# Altium schematic sheet POWER.SchDoc
size A; SheetNumber: 4; SheetTotal: 4
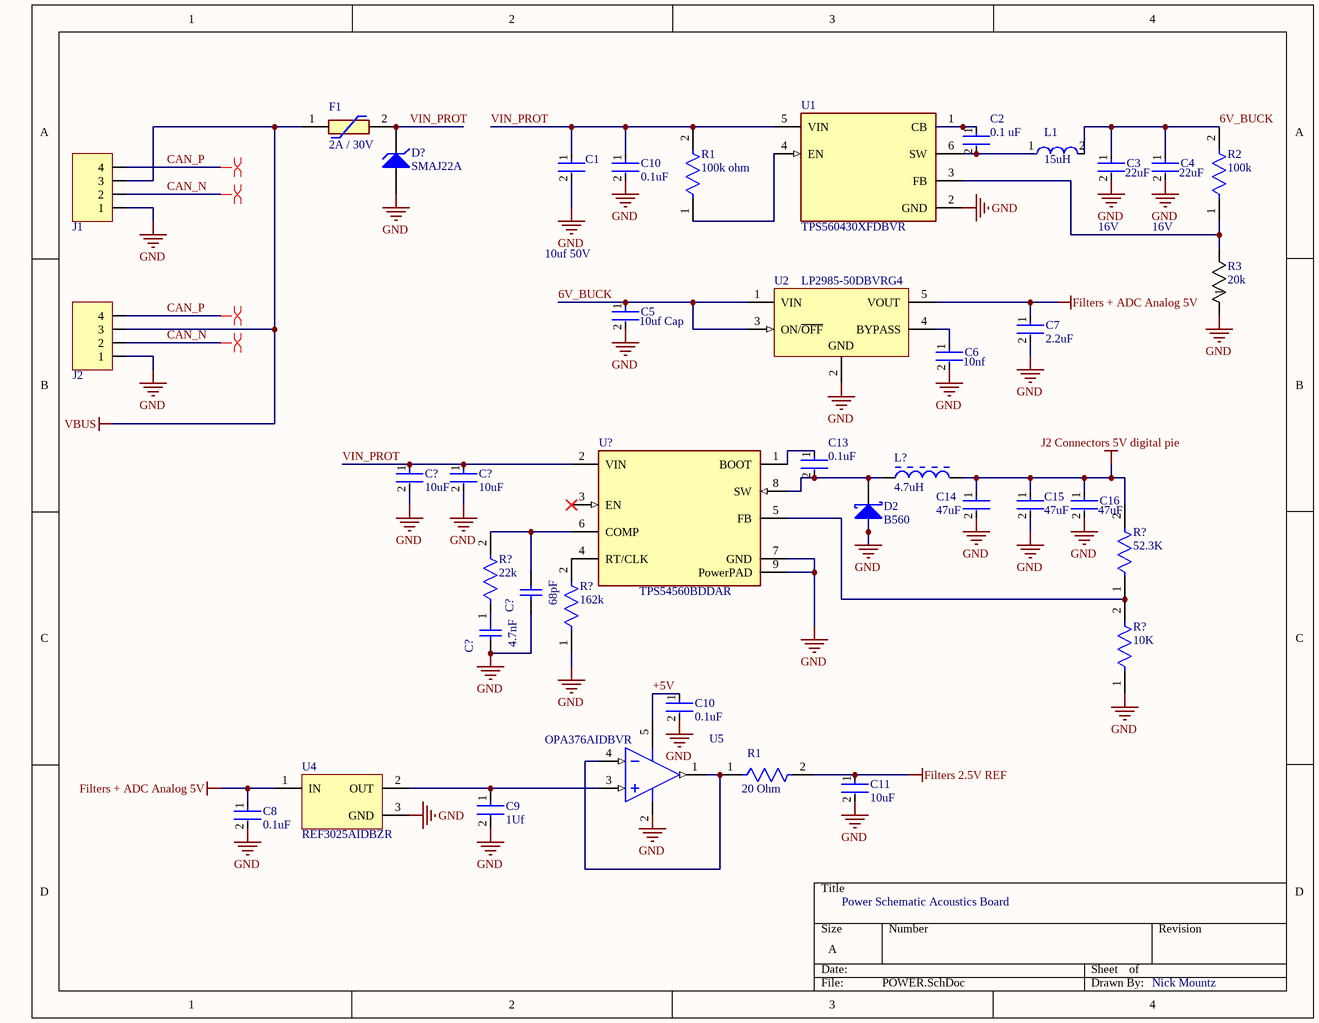
[diagram p0: POWER.SchDoc]

## Parts
(Parts that share a designator on the sheet are numbered #1, #2 ... from top to bottom, then left to right.)
?  47uF  [FP-ZRB18A-0_2-MFG]
C1  10uf 50V  [FP-ZRB15X-0_22-MFG]
C2  0.1 uF  [FP-GRMJN6-0_1-MFG]
C3  22uF  [FP-GCJ31C-0_3-MFG]
C4  22uF  [FP-GCJ31C-0_3-MFG]
C5  10uf Cap  [FP-ZRB15X-0_22-MFG]
C6  10nf  [FP-C0805C103K8RACAUTO-MFG]
C7  2.2uF  [FP-ZRB155-0_2-MFG]
C8  0.1uF  [FP-GRM022-0_02-IPC_C]
C9  1Uf  [FP-RCE1K1-MFG]
C10#1  0.1uF  [FP-GRM022-0_02-IPC_C]
C10#2  0.1uF  [FP-GRM022-0_02-IPC_C]
C11  10uF  [FP-ZRB15X-0_22-MFG]
C13  0.1uF  [FP-ZRB15X-0_22-MFG]
C15  47uF  [FP-ZRB18A-0_2-MFG]
C16  47uF  [FP-ZRB18A-0_2-MFG]
C?#1  10uF  [FP-ZRB15X-0_22-MFG]
C?#2  10uF  [FP-ZRB15X-0_22-MFG]
C?#3  68pF  [WCAP-CSMH_1808_H1.25]
C?#4  4.7nF  [WCAP-CSGP_0402_L1W0.5H0.5]
D2  B560  [DIOD-B5X0C-2_M]
D?  SMAJ22A  [LFUS-DO-214AC-2_L]
F1  2A / 30V  [MFLSMF20033X2]
J1  Microfit+ R/A  [CONN_MOLEX_MICROFIT+_4_POS_R/A - duplicate]  (value not drawn)
J2  Microfit+ R/A  [CONN_MOLEX_MICROFIT+_4_POS_R/A - duplicate]  (value not drawn)
L1  15uH  [FP-IHLP-6767GZ-FP_3_825x1-MFG]
L?  4.7uH  [BOUR-SRN3015-2_V]
R1#1  100k ohm  [FP-RQ73C2A-IPC_B]
R1#2  20 Ohm  [FP-AF0201-IPC_A]
R2  100k  [FP-RQ73C2A-IPC_B]
R3  20k  [MCA 1206_VIS]
R?#1  52.3K  [FP-MCR03-IPC_C]
R?#2  22k  [FP-CRGP0603-IPC_C]
R?#3  162k  [FP-RP73P-1E-MFG]
R?#4  10K  [FP-AC0603-IPC_A]
U1  TPS560430XFDBVR  [FP-DBV0006A-IPC_C]
U2  LP2985-50DBVRG4  [DBV0005A_L]
U4  REF3025AIDBZR  [DBZ0003A_L]
U5  OPA376AIDBVR  [DBV0005A_L]
U?  TPS54560BDDAR  [FP-DDA0008E-MFG]

## Nets
Filters 2.5V REF: C11.1 R1#2.2
Filters + ADC Analog 5V: C7.1 C8.1 U2.5(VOUT) U4.1(IN)
GND: ?.2 C1.2 C3.2 C4.2 C5.2 C6.2 C7.2 C8.2 C9.2 C10#1.2 C10#2.2 C11.2 C15.2 C16.2 C?#1.2 C?#2.2 C?#3.1 C?#4.1 D2.2(A) D?.1(A) J1.1 J2.1 R3.1 R?#3.1 R?#4.1 U1.2(GND) U2.2(GND) U4.3(GND) U?.7(GND) U?.9(PowerPAD)
J2 Connectors 5V digital pie: ?.1 C15.1 C16.1 L?.2 R?#1.2
VBUS: F1.1 J1.3 J2.3
6V_BUCK: C3.1 C4.1 C5.1 L1.2 R2.2 U2.1(VIN) U2.3(ON/~{OFF})
+5V: C10#2.1 U5.5(V+)
CAN_N: J1.2 J2.2
CAN_P: J1.4 J2.4
VIN_PROT: C1.1 C10#1.1 C?#1.1 C?#2.1 D?.2(K) F1.2 R1#1.2 U1.5(VIN) U?.2(VIN)
NetC2_1: C2.1 U1.1(CB)
NetC2_2: C2.2 L1.1 U1.6(SW)
NetC6_1: C6.1 U2.4(BYPASS)
NetC9_1: C9.1 U4.2(OUT) U5.3(IN+)
NetC13_1: C13.1 U?.1(BOOT)
NetC13_2: C13.2 D2.1(K) L?.1 U?.8(SW)
NetC?#3_2: C?#3.2 R?#2.2 U?.6(COMP)
NetC?#4_2: C?#4.2 R?#2.1
NetR1#1_1: R1#1.1 U1.4(EN)
NetR1#2_1: R1#2.1 U5.1(OUT) U5.4(IN-)
NetR2_1: R2.1 R3.2 U1.3(FB)
NetR?#1_1: R?#1.1 R?#4.2 U?.5(FB)
NetR?#3_2: R?#3.2 U?.4(RT/CLK)

Not connected (* = marked no-connect by the designer): U5 2(V-); U? 3(EN)*

## Layout directives
differential pair: CAN_N, CAN_P

## Notes on the sheet
- 16V
- (near L?) C14
- Power Schematic Acoustics Board
- Nick Mountz
- Labels drawn without touching a wire or pin: GND

## Library data of the parts
? C15 C16 = CMP-06035-063273-1: Low Acoustic Noise Chip Multilayer Ceramic Capacitors on Interposer Board for General Purpose 	47μF ±20% 2.5VDC SMD 0603
C1 C5 C11 C13 C?#1 C?#2 = CMP-06035-063245-1: Multilayer Ceramic Capacitors on Interposer Board for General Purpose 10μF ±20% 4VDC X6S  SMD  0402
C2 = CMP-00260-135708739-1: GRMJN65C1H104JE01D Multilayer Ceramic Capacitor, 0.1 uF, 50 V, ± 5%, C0G (NP0), 0704 [1810 Metric]; Temperature Coefficient: 30ppm/°C; Capacitance: 100nF; Voltage Rating: 50V; Tolerance: 5%; Min Operating Temperature: -55°C; Case/Package: 0704; Material: Ceramic; NexarPartId: 135708739; Height: 650µm; Lifecycle Status: Production; Max Operating Temperature: 125°C
C3 C4 = CMP-06035-003359-1: Cap Ceramic 22uF 10V X7R 20% Pad SMD 1206 Soft Termination  +125°C Automotive T/R
C6 = CMP-00212-126448506-1: C0805C103K8RACAUTO Cap, 0.01UF, 10V, Mlcc, 0805 Rohs Compliant: Yes; Material: Ceramic; Dielectric: X7R; Tolerance: 10%; Height: 880µm; NexarPartId: 126448506; Voltage Rating: 10V; Voltage Rating (DC): 10V; Min Operating Temperature: -55°C; Capacitance: 10nF; Max Operating Temperature: 125°C; Case/Package: 0805; RoHS: Compliant
C7 = CMP-06035-063357-1: Low Acoustic Noise Chip Multilayer Ceramic Capacitors on Interposer Board for General Purpose ZRB Series 0402 Package X5R @ 15% 25Vdc 2.2uF @ 20%
C8 C10#1 C10#2 = CMP-06035-051810-1: Chip Multilayer Ceramic Capacitors for General Purpose, 01005, 0.10uF, X5R, 15%, 20%, 10V
C9 = CMP-00260-148573931-1: RCEC72A105K1K1H03B; Capacitance: 1µF; Tolerance: 10%; Material: Ceramic; Voltage Rating: 100V; Min Operating Temperature: -55°C; Case/Package: Radial; Max Operating Temperature: 125°C; Lifecycle Status: Production; Height: 5mm
C?#3 = CMP-03913-89205720-2: Cap Ceramic 68pF 3000V C0G 5% Pad SMD 1808 125C T/R; Insulation Resistance: 10GΩ; Voltage Rating (DC): 3kV; Voltage Rating: 3kV; Min Operating Temperature: -55°C; Length: 4.5mm; Max Operating Temperature: 125°C; RoHS: Compliant; Width: 2.03mm; Capacitance: 68pF; Height: 1.25mm
C?#4 = CMP-03913-53703202-2: Cap Ceramic 0.0047uF 50V X7R 10% Pad SMD 0402 125C T/R; Insulation Resistance: 10GΩ; Material: Ceramic; Tolerance: 10%; Length: 1mm; RoHS: Compliant; Max Operating Temperature: 125°C; Capacitance: 4.7nF; Voltage Rating: 50V; Case/Package: 0402; Width: 500µm; Mount: Surface Mount; Min Operating Temperature: -55°C; Case Code (Imperial): 0402; Height: 500µm; Packaging: Tape & Reel (TR); Thickness: 558.8µm; Case Code (Metric): 1005
D2 = CMP-2000-05098-2: Schottky Barrier Rectifier, 5 A, 60 V, -55 to 125 degC, 2-Pin SMD, RoHS, Tape and Reel; Ir - Reverse Current: 500uA; Configuration: Single; Ifsm - Forward Surge Current: 100A; Vrrm - Repetitive Reverse Voltage: 60V; Brand: DiodesIncorporated; Vf - Forward Voltage: 0.7V; If - Forward Current: 5A; Unit Weight: 0.007408oz; Type: SchottkyBarrierRectifier; Package / Case: SMC; Manufacturer URL: http://www.diodes.com/; Datasheet URL: https://datasheet.ciiva.com/27052/1538961-27052355.pdf; Factory Pack Quantity: 3000; Height: 2.5mm; Width: 6.22mm; Product Category: SchottkyDiodes&Rectifiers; Minimum Operating Temperature: -55C; Manufacturer: DiodesIncorporated; Datasheet Version: Rev. 7-2, 06/2007; Product: SchottkyDiodes; Maximum Operating Temperature: +125C; Operating Temperature Range: -55Cto+125C; Technology: Si; Length: 7.11mm; RoHS: True; Packaging: Reel; Termination Style: SMD/SMT; Series: B560; Mounting Style: SMD/SMT
D? = CMP-2000-07086-1: Transient Voltage Suppression Diode, 400 W, 22 V, -65 to 150 degC, 2-Pin SMD, RoHS, Tape and Reel; Manufacturer: Littelfuse; Power Dissipation: 400W; Directional: Uni-Directional; Breakdown Voltage-Min: 24.4V; Clamping Voltage-Max: 35.5V; Breakdown Voltage-Max: 26.9V; Manufacturer URL: http://www.littelfuse.com/; Datasheet Version: 11/2015; Package Reference: DO-214AC; Package Description: 2-Pin Surface Mount Device, Body 4.295 x 2.595 mm; Datasheet URL: http://www.littelfuse.com/~/media/electronics/datasheets/tvs_diodes/littelfuse_tvs_diode_smaj_datasheet.pdf.pdf; Mounting Technology: SurfaceMount
F1 = MF-LSMF200_33X-2: Resettable Fuse; Manufacturer_Name: Bourns; Manufacturer_Part_Number: MF-LSMF200/33X-2; Datasheet Link: https://www.bourns.com/docs/product-datasheets/mf-lsmf.pdf; Height: 1.6mm
J1 J2 = CONN_MOLEX_MICROFIT+_4POS_R/A: Molex Microfit+ / 212528 4 POS R/A Black; Pitch: 3.0mm; Current Per Pin: 12.5A; Manufacturer: Molex; Supplier 1: Digikey; Supplier Part Number 1: 900-2125280400-ND; Configuration: R/A; Color: Black
L1 = CMP-02424-000082-1: Commercial Inductors, High Saturation Series 15uH 12.5A 19.9mΩ 20%; DC Resistance (DCR): 19.9mR; Self Resonant Frequency: 2MHz; Saturation Current: 25A; Core Material: Metal; Shielding: Shielded; Test Frequency: 100kHz; Inductance: 15uH; Depth: 17.15mm; Case/Package: 6767; Height - Seated (Max): 0.157inch; Mount: Surface Mount; Contact Plating: Tin; Radiation Hardening: No; Tolerance: 20%; Lead Free: Lead Free; Military Standard: Not; Height: 7mm; Width: 0.675inch; Max Operating Temperature: 125°C; Packaging: Tape and Reel; Min Operating Temperature: -55°C; Package Quantity: 200; Length: 17.28mm; Termination: SMD/SMT; Current Rating: 12.5A; Max DC Current: 25A
L? = CMP-0007-00005-1: Semi-shielded Power Inductor, 4.7 uH, +/- 20%, 1.4 A, -40 to 125 degC, 3 x 3 x 1.5 mm SMD, RoHS and Halogen Free, Tape and Reel; Manufacturer: Bourns; PartNumber: SRN3015-4R7M; SRF Min: 65 MHz; Isat: 1.2 A; Resistance to Solder Heat: +260 degC for 10 sec.; Rated current: 1.4 A; Inductance tolerance: +/- 20%; DCR Max: 0.136 Ohm; RoHS: TRUE; Inductance: 4.7 uH; ComponentLink2Description: Datasheet; PackageDescription: 2-Pin SMD, Body 3 x 3 mm, Height 1.5 mm; ComponentLink2URL: http://www.bourns.com/data/global/pdfs/SRN3015.pdf; ComponentLink1URL: http://www.bourns.com/; Packing: Tape and Reel; Mounting Technology: Surface Mount; ComponentLink3URL: http://www.bourns.com/data/global/pdfs/SRN3015.pdf; PackageReference: SRN3015; Operating Temperature: -40 to 125 degC; DatasheetVersion: Aug-11; ComponentLink1Description: Manufacturer URL; ComponentLink3Description: Package Specification
R1#1 R2 = CMP-03211-011351-1: RQ73 0805 100KΩ 0.2W 10ppm/°C 0.1% 100V
R1#2 = CMP-03412-047168-1: Anti-Sulfurated Chip Resistors Automotive Grade 20Ω 5% 200ppm/°C 0201; Max Power Dissipation: 50mW; Resistance: 20R; Temperature Coefficient: 200ppm/°C; Height: 0.01inch; Packaging: Tape and Reel; Case/Package: 0201; Number of Terminations: 2; Length: 0.024inch; Series: AF; Max Operating Temperature: 125°C; Resistor Type: Thick Film; Min Operating Temperature: -55°C; Features: Moisture Resistant; Width: 0.012inch; Tolerance: 5%; RoHS Compliant: Yes
R3 = CMP-00030-44469054-1: MCA12060D2002BP500 SMD Chip Resistor, 20 kOhm, ± 0.1%, 250 mW, 1206 [3216 Metric], Thin Film, Precision; Resistance: 20kΩ; Temperature Coefficient: 25ppm/°C; Power Rating: 250mW; Voltage Rating: 200V; RoHS: Compliant; NexarPartId: 44469054; Lead Free: Lead Free; Composition: Thin Film; Tolerance: 0.1%; Min Operating Temperature: -55°C; Max Operating Temperature: 125°C; Depth: 1.6mm; Packaging: Tape and Reel; Military Standard: Not; Height: 650µm; Width: 1.6mm; Case/Package: 1206; Length: 3.2mm
R?#1 = CMP-08839-006883-1: Thick Film Chip Resistor, 0603, 52.3kΩ, 1%, 100ppm/°C, 0.1W, 50V
R?#2 = CMP-03211-006681-1: CRGP 0603 22K 1%; Manufacturer Part Number: CRGP0603F22K; Manufacturer: TE; Resistance: 22KΩ; Power Rating: 0.25W; Temperature Coefficient: ±100ppm/°C; Tolerance: 0.01; Voltage Rating: 50V; Value: 22KΩ; Lead Free: Yes; Device Class L3: Chip SMD Resistors; Ipc Land Pattern Name: RESC16080X45; Composition: Thick Film; Octopart: https://octopart.com/crgp0603f22k-te+connectivity-91018742; RoHS: TRUE; ComponentLink2Description: Datasheet; Digikey Description: CRGP 0603 22K 1%; Category: Res; Temperature: -55°C to +155°C; Temperature Range High: +155°C; Series: CRGP; ComponentLink2URL: https://www.te.com/commerce/DocumentDelivery/DDEController?Action=srchrtrv&DocNm=9-1773463-9&DocType=DS&DocLang=English; Device Class L2: Resistors; Height: 0.55mm; Ambient Temperature Range High: +70°C; Device Class L1: Passive Components; Automotive: No; Temperature Range Low: -55°C; Package: CRGP0603
R?#3 = CMP-03211-007818-1: RP73P 0402 162KΩ 0.1W 25ppm/°C 0.10% 50V; Manufacturer Part Number: RP73PF1E162KBTD; Manufacturer: TE Connectivity; Temperature Range High: +155°C; Device Class L1: Passive Components; Voltage Rating: 50V; Category: Res; Ipc Land Pattern Name: RESC10050X30; RoHS: TRUE; Resistance: 162KΩ; Device Class L3: Chip SMD Resistors; Octopart: https://octopart.com/rp73pf1e162kbtd-te+connectivity-89229970; Value: 162KΩ; Lead Free: Yes; Device Class L2: Resistors; ComponentLink2URL: https://www.te.com/commerce/DocumentDelivery/DDEController?Action=srchrtrv&DocNm=1773272&DocType=DS&DocLang=English; Automotive: No; Package: RP73P-1E; Tolerance: 0.10%; ComponentLink2Description: Datasheet; Height: 0.35mm; Temperature: -55°C to +155°C; Series: RP73P; Power Rating: 0.1W; Temperature Coefficient: 25ppm/°C; Composition: Thin Film; Temperature Range Low: -55°C
R?#4 = CMP-03412-040683-1: RES 10kΩ 5.00% 0.2W 0603
U1 = CMP-04918-000208-1: IC REG BUCK PWM 600MA SOT23-6; Max Output Voltage: 34.2V; Switching Frequency: 1.1MHz; Synchronous Rectifier: Yes; Min Output Voltage: 1V; Number of Outputs: 1; Max Input Voltage: 36V; Output Configuration: Positive; Min Input Voltage: 4V; RoHS Compliant: Yes; Output Current: 600mA; Max Operating Temperature: 125°C; Output Type: PWM; Mount: Surface Mount; Min Operating Temperature: -40°C; Packaging: Tape and Reel; Case/Package: SOT-23-6; Features: UVLO
U2 = CMP-0758-00083-2: Single Output Low Noise LDO, 150 mA, Fixed 5 V Output, 1.5% Tolerance, 2.2 to 16 V Input, Low IQ, 5-Pin SOT-23 (DBV), -40 to 125 degC, Green (RoHS & no Sb/Br), Tape and Reel; Manufacturer: Texas Instruments; Vdo (Typ) (mV): 280; Fixed Output Options (V): 5; Accuracy (%): 1.5; Output Options: Fixed Output; Iout (Max) (A): 0.15; Iq (Typ) (mA): 0.85; Packing: Tape and Reel; ComponentLink2URL: http://www.ti.com/lit/ds/symlink/lp2985-50.pdf; Vin (V): 2.2 to 16; ComponentLink3URL: http://www.ti.com/litv/pdf/mpds018j; Operating Temperature Range (degC): -40 to 125; ComponentLink3Description: Package Specification; ComponentLink1Description: Manufacturer URL; RoHS: TRUE; PackageReference: DBV0005A; PackageDescription: 5-Pin Plastic Small Outline, Body 2.9 x 1.6 mm, Pitch 0.95 mm; DatasheetVersion: SLVS522N; PackageVersion: 4073253-4/L; Mounting Technology: Surface Mount; ComponentLink1URL: http://www.ti.com/; PartNumber: LP2985-50DBVRG4; ComponentLink2Description: Datasheet
U4 = CMP-0367-00155-2: 2.5 V, 50 ppm / degC, 50 uA Series (Bandgap) Voltage Reference, -40 to 125 degC, 3-pin SOT-23 (DBZ), Green (RoHS & no Sb/Br); Manufacturer: Texas Instruments; SubFamily: Series Voltage Reference; Initial Accuracy @ 25/deg C(%): 0.2; Temp Coeff(Max)(ppm/ degree C): 50; VI(Min)(V): 2.501; Temp Coeff(Typ)(ppm/ degree C): 20; VI(Max)(V): 5.5; VO(V): 2.5; Rating: Catalog; Eco-Plan: Green (RoHS & no Sb/Br); ComponentLink1URL: http://www.ti.com/; ComponentLink2Description: Datasheet; Code_JEDEC: TO-236; ComponentLink3Description: Package Specification; Iq(Max)(uA): 50; ComponentLink1Description: Manufacturer URL; ComponentLink3URL: http://www.ti.com/litv/pdf/mpds108a; ComponentLink2URL: http://www.ti.com/general/docs/lit/getliterature.tsp?genericPartNumber=REF3025&fileType=pdf; Mounting Technology: Surface Mount; PartNumber: REF3025AIDBZR; DatasheetVersion: SBVS032F; PackageVersion: 4203227/B; PackageDescription: 3-Pin Plastic Small Outline, Body 2.92 x 1.3 mm, Pitch 0.95 mm; PackageReference: DBZ0003A
U5 = CMP-0272-00842-3: Precision, Low Noise, Low Iq Operational Amplifier, 2.2 to 5.5 V, -40 to 125 degC, 5-pin SOT23 (DBV5), Green (RoHS & no Sb/Br); Manufacturer: Texas Instruments; Offset Drift(Typ)(uV/C): 0.32; Iq per channel(Max)(mA): 0.95; Vn at 1kHz(Typ)(nV/rtHz): 7.5; Total Supply Voltage(Min)(+5V is 5, +/-5V is 10): 2.2; Number of Channels: 1; Slew Rate(Typ)(V/us): 2; CMRR(Min)(dB): 76; Total Supply Voltage(Max)(+5V is 5, +/-5V is 10): 5.5; Vio (25C)(Max)(mV): 0.025; IIB(Max)(pA): 10; Sub Family: Low Input Bias Current Amp (<=10pA), Low Noise Amp (<=10nV/rtHz), Low Offset Voltage Amplifier (<=500uV), Low Supply Voltage Amplifier (<=2.7V), Precision Amplifier; Code_JEDEC: MO-178; DatasheetVersion: SBOS406F; ComponentLink3Description: Package Specification; PackageVersion: 4073253-4/K, 03/2006; ComponentLink2Description: Datasheet; PackageDescription: 5-Pin Plastic Small Outline, Body 1.6 x 2.9 mm, Pitch 0.95 mm; ComponentLink1URL: http://www.ti.com/; Mounting Technology: Surface Mount; PartNumber: OPA376AIDBVR; ComponentLink1Description: Manufacturer URL; ComponentLink3URL: http://www.ti.com/litv/pdf/mpds018i; PackageReference: DBV0005A; ComponentLink2URL: http://www.ti.com/general/docs/lit/getliterature.tsp?genericPartNumber=OPA376&fileType=pdf; Eco-Plan: Green (RoHS & no Sb/Br)
U? = CMP-04918-000346-1: IC REG CTRLR